# EAGLE design Video (EAGLE 4.13)
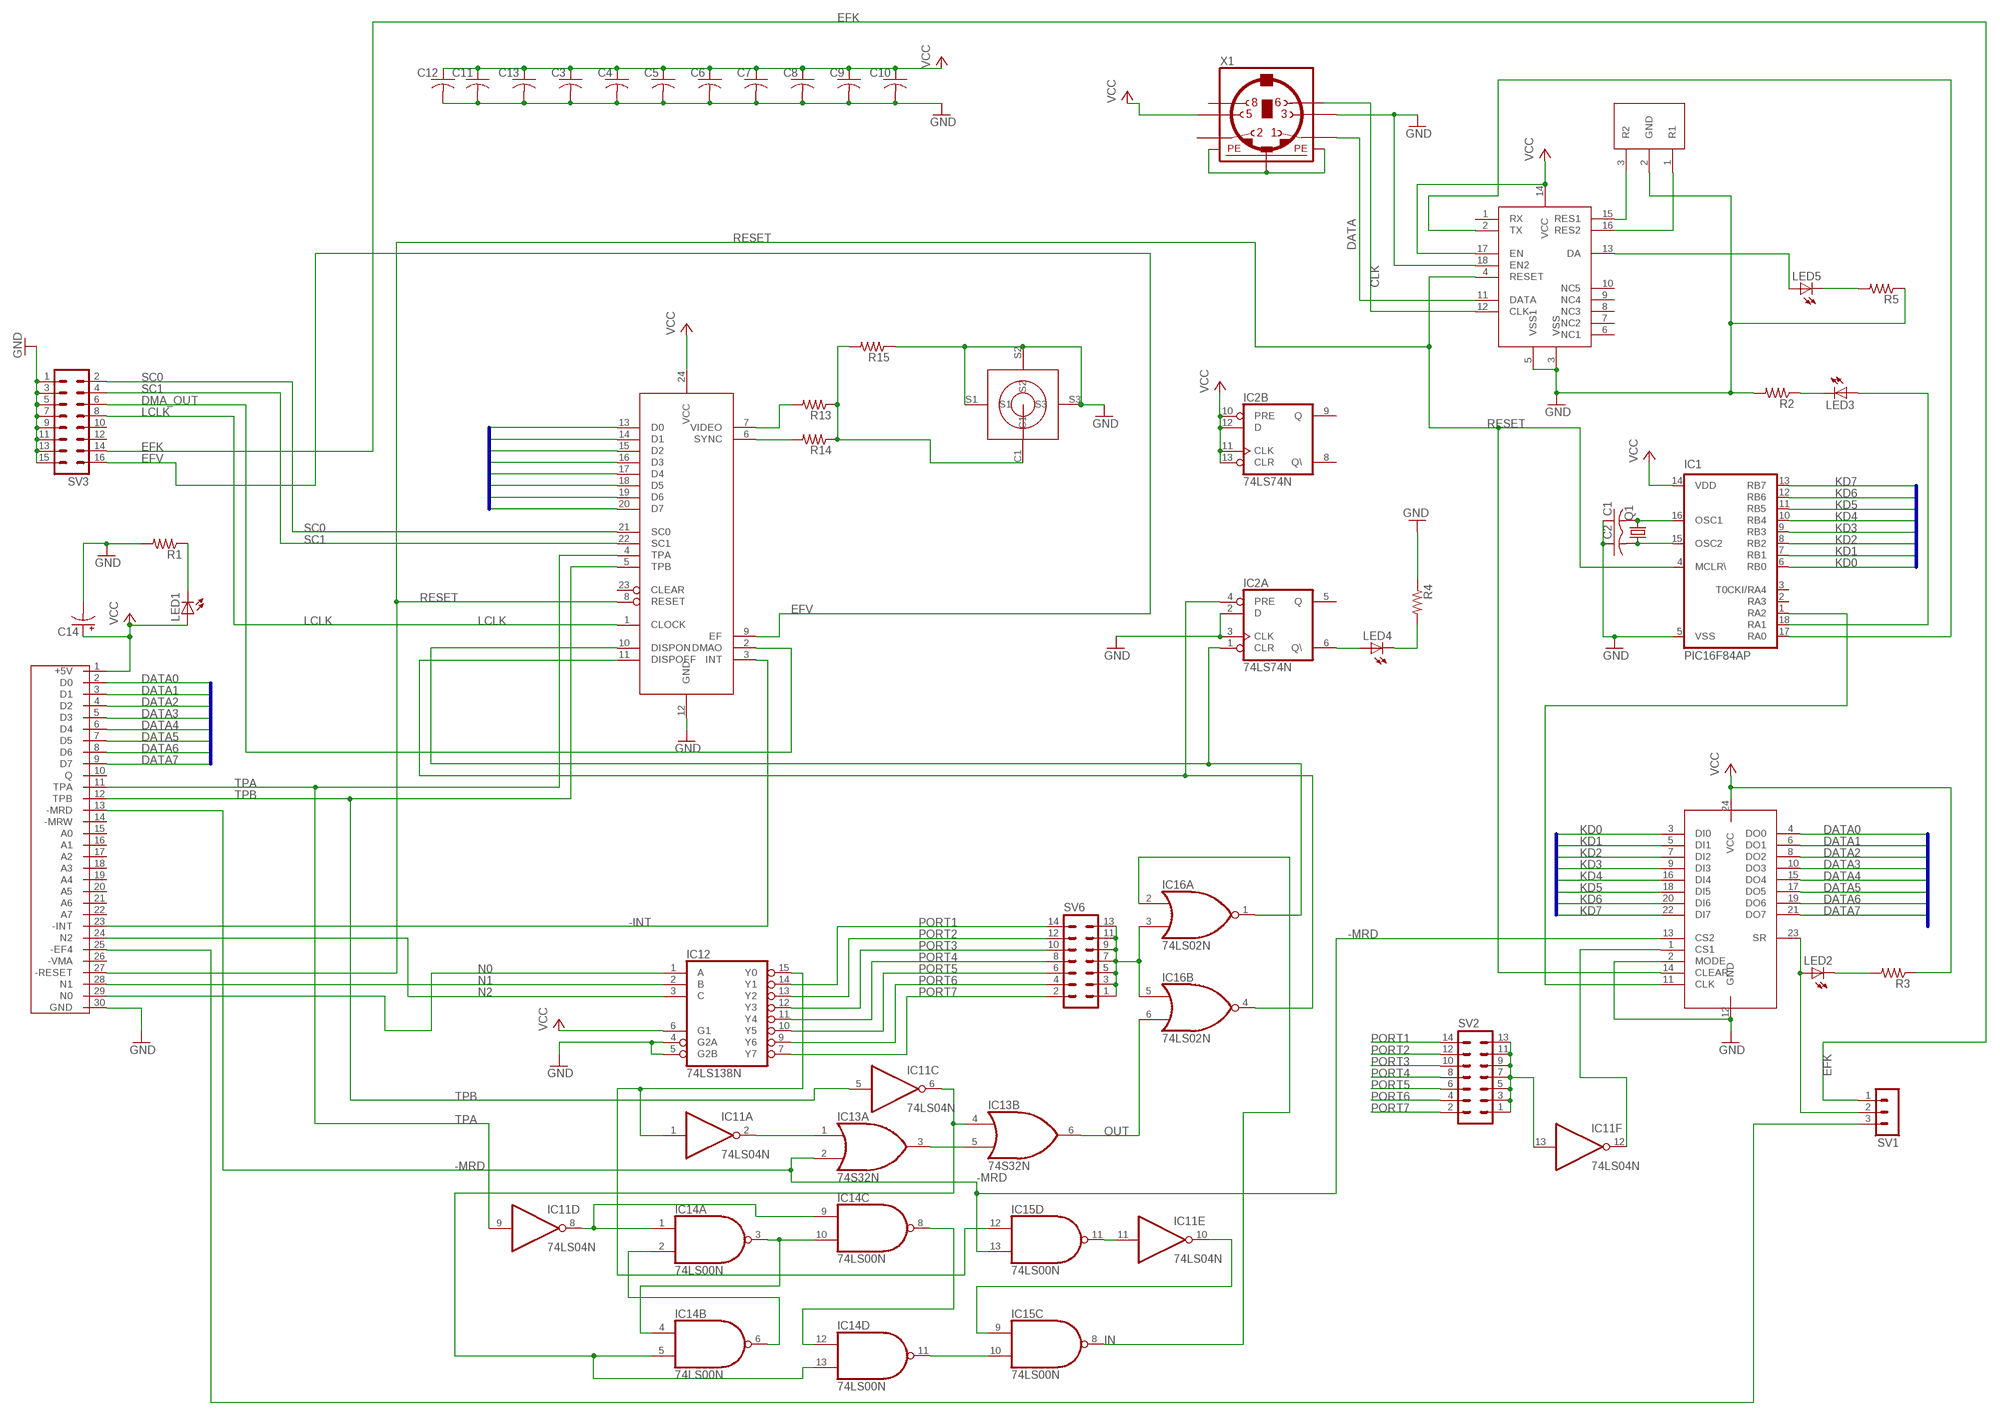
[diagram p0: schematic, sheet 1]

## Parts
C1  C-US025-024X044  [C025-024X044]
C2  C-US025-024X044  [C025-024X044]
C3  C-US025-050X050  [C025-050X050]
C4  C-US025-050X050  [C025-050X050]
C5  C-US025-050X050  [C025-050X050]
C6  C-US025-050X050  [C025-050X050]
C7  C-US025-050X050  [C025-050X050]
C8  C-US025-050X050  [C025-050X050]
C9  C-US025-050X050  [C025-050X050]
C10  C-US025-050X050  [C025-050X050]
C11  C-US025-050X050  [C025-050X050]
C12  C-US025-050X050  [C025-050X050]
C13  C-US025-050X050  [C025-050X050]
C14  CPOL-USE2.5-7  [E2,5-7]
IC1  PIC16F84AP  [DIL18]
IC2  74LS74N  [DIL14]
IC11  74LS04N  [DIL14]
IC12  74LS138N  [DIL16]
IC13  74S32N  [DIL14]
IC14  74LS00N  [DIL14]
IC15  74LS00N  [DIL14]
IC16  74LS02N  [DIL14]
LED1  LED5MM  [LED5MM]
LED2  LED5MM  [LED5MM]
LED3  LED5MM  [LED5MM]
LED4  LED5MM  [LED5MM]
LED5  LED5MM  [LED5MM]
Q1  CRYTALHC49U-V  [HC49U-V]
R1  R-US_0207/2V  [0207/2V]
R2  R-US_0207/2V  [0207/2V]
R3  R-US_0207/2V  [0207/2V]
R4  R-US_0207/2V  [0207/2V]
R5  R-US_0207/2V  [0207/2V]
R13  R-US_0207/2V  [0207/2V]
R14  R-US_0207/2V  [0207/2V]
R15  R-US_0207/2V  [0207/2V]
SV1  MA03-1  [MA03-1]
SV2  MA07-2  [MA07-2]
SV3  MA08-2  [MA08-2]
SV6  MA07-2  [MA07-2]
U$1  1852  [DIL24]
U$2  C30  [C30]
U$3  CDP1861  [DIP24]
U$4  RCA  [RCA]
U$5  PAKVI  [DIL18]
U$6  RESONATOR  [MA03-1]
X1  MINI_DIN_6  [M_DIN6]

## Nets
-INT: U$2.23(-INT) U$3.3(INT)
-MRD: IC13.2(A:I1) IC15.13(D:I1) U$1.13(CS2) U$2.13(-MRD)
CLK: U$5.12(CLK) X1.6
DATA: U$5.11(DATA) X1.1
DATA0: U$1.4(DO0) U$2.2(D0) U$3.13(D0)
DATA1: U$1.6(DO1) U$2.3(D1) U$3.14(D1)
DATA2: U$1.8(DO2) U$2.4(D2) U$3.15(D2)
DATA3: U$1.10(DO3) U$2.5(D3) U$3.16(D3)
DATA4: U$1.15(DO4) U$2.6(D4) U$3.17(D4)
DATA5: U$1.17(DO5) U$2.7(D5) U$3.18(D5)
DATA6: U$1.19(DO6) U$2.8(D6) U$3.19(D6)
DATA7: U$1.21(DO7) U$2.9(D7) U$3.20(D7)
DMA_OUT: SV3.6 U$3.2(DMAO)
EFK: SV1.1 SV3.14
EFV: SV3.16 U$3.9(EF)
GND: C1.1 C2.1 C3.2 C4.2 C5.2 C6.2 C7.2 C8.2 C9.2 C10.2 C11.2 C12.2 C13.2 C14.- IC1.5(VSS) IC2.2(A:D) IC2.3(A:CLK) IC12.4(G2A) IC12.5(G2B) R1.2 R2.2 R4.1 R5.1 R15.1 SV3.1 SV3.3 SV3.5 SV3.7 SV3.9 SV3.11 SV3.13 SV3.15 U$1.2(MODE) U$1.12(GND) U$2.30(GND) U$3.12(GND) U$4.S1 U$4.S2 U$4.S3 U$5.3(VSS) U$5.5(VSS1) U$5.18(EN2) U$6.2(GND) X1.3
IN: IC15.8(C:O) IC16.2(A:I0)
KD0: IC1.6(RB0) U$1.3(DI0)
KD1: IC1.7(RB1) U$1.5(DI1)
KD2: IC1.8(RB2) U$1.7(DI2)
KD3: IC1.9(RB3) U$1.9(DI3)
KD4: IC1.10(RB4) U$1.16(DI4)
KD5: IC1.11(RB5) U$1.18(DI5)
KD6: IC1.12(RB6) U$1.20(DI6)
KD7: IC1.13(RB7) U$1.22(DI7)
LCLK: SV3.8 U$3.1(CLOCK)
N0: IC12.1(A) U$2.29(N0)
N1: IC12.2(B) U$2.28(N1)
N2: IC12.3(C) U$2.24(N2)
N$1: U$5.15(RES1) U$6.3(R2)
N$2: U$5.16(RES2) U$6.1(R1)
N$3: IC1.17(RA0) U$5.2(TX)
N$4: LED3.K(C) R2.1
N$5: IC11.1(A:I) IC12.15(Y0) IC15.12(D:I0)
N$6: IC1.18(RA1) LED3.A
N$7: R14.2 U$3.6(SYNC)
N$8: R13.2 U$3.7(VIDEO)
N$9: R13.1 R14.1 R15.2 U$4.C1
N$10: IC11.2(A:O) IC13.1(A:I0)
N$11: IC13.3(A:O) IC13.5(B:I1)
N$12: IC14.3(A:O) IC14.4(B:I0) IC14.10(C:I1)
N$13: IC14.2(A:I1) IC14.6(B:O)
N$14: IC11.8(D:O) IC14.1(A:I0) IC14.9(C:I0)
N$15: IC1.1(RA2) U$1.11(CLK)
N$16: LED2.A SV1.2 U$1.23(SR)
N$17: SV1.3 U$2.25(-EF4)
N$18: IC11.12(F:O) U$1.1(CS1)
N$19: C1.2 IC1.16(OSC1) Q1.2
N$20: IC11.13(F:I) SV2.1 SV2.3 SV2.5 SV2.7 SV2.9 SV2.11 SV2.13
N$21: C2.2 IC1.15(OSC2) Q1.1
N$22: LED1.K(C) R1.1
N$23: LED2.K(C) R3.2
N$24: IC2.6(A:Q\) LED4.A
N$25: LED4.K(C) R4.2
N$26: IC14.8(C:O) IC14.12(D:I0)
N$27: LED5.A U$5.13(DA)
N$28: IC11.6(C:O) IC13.4(B:I0) IC14.5(B:I1) IC14.13(D:I1)
N$29: LED5.K(C) R5.2
N$30: X1.SH1(PE1) X1.SH2(PE2) X1.SH3(PE3)
N$39: IC14.11(D:O) IC15.10(C:I1)
N$40: IC11.10(E:O) IC15.9(C:I0)
N$41: IC11.11(E:I) IC15.11(D:O)
N$42: IC16.3(A:I1) IC16.5(B:I0) SV6.1 SV6.3 SV6.5 SV6.7 SV6.9 SV6.11 SV6.13
N$43: IC2.1(A:CLR) IC16.1(A:O) U$3.10(DISPON)
N$44: IC2.4(A:PRE) IC16.4(B:O) U$3.11(DISPOFF)
OUT: IC13.6(B:O) IC16.6(B:I1)
PORT1: IC12.14(Y1) SV2.14 SV6.14
PORT2: IC12.13(Y2) SV2.12 SV6.12
PORT3: IC12.12(Y3) SV2.10 SV6.10
PORT4: IC12.11(Y4) SV2.8 SV6.8
PORT5: IC12.10(Y5) SV2.6 SV6.6
PORT6: IC12.9(Y6) SV2.4 SV6.4
PORT7: IC12.7(Y7) SV2.2 SV6.2
RESET: IC1.4(MCLR\) U$1.14(CLEAR) U$2.27(-RESET) U$3.8(RESET) U$5.4(RESET)
SC0: SV3.2 U$3.21(SC0)
SC1: SV3.4 U$3.22(SC1)
TPA: IC11.9(D:I) U$2.11(TPA) U$3.4(TPA)
TPB: IC11.5(C:I) U$2.12(TPB) U$3.5(TPB)
VCC: C3.1 C4.1 C5.1 C6.1 C7.1 C8.1 C9.1 C10.1 C11.1 C12.1 C13.1 C14.+ IC1.14(VDD) IC2.10(B:PRE) IC2.11(B:CLK) IC2.12(B:D) IC2.13(B:CLR) IC12.6(G1) LED1.A R3.1 U$1.24(VCC) U$2.1(+5V) U$3.24(VCC) U$5.14(VCC) U$5.17(EN) X1.5
Unconnected: IC1.2(RA3) IC1.3(T0CKI/RA4) IC2.5(A:Q) IC2.8(B:Q\) IC2.9(B:Q) IC11.3(B:I) IC11.4(B:O) IC13.8(C:O) IC13.9(C:I0) IC13.10(C:I1) IC13.11(D:O) IC13.12(D:I0) IC13.13(D:I1) IC15.1(A:I0) IC15.2(A:I1) IC15.3(A:O) IC15.4(B:I0) IC15.5(B:I1) IC15.6(B:O) IC16.8(C:I0) IC16.9(C:I1) IC16.10(C:O) IC16.11(D:I0) IC16.12(D:I1) IC16.13(D:O) SV3.10 SV3.12 U$2.10(Q) U$2.14(-MRW) U$2.15(A0) U$2.16(A1) U$2.17(A2) U$2.18(A3) U$2.19(A4) U$2.20(A5) U$2.21(A6) U$2.22(A7) U$2.26(-VMA) U$3.23(CLEAR) U$5.1(RX) U$5.6(NC1) U$5.7(NC2) U$5.8(NC3) U$5.9(NC4) U$5.10(NC5) X1.2 X1.8

## Buses
DATA[0..7]
KD[0..7]

## Power pins joined to a net without a drawn wire
GND: IC2.7(P:GND) IC11.7(P:GND) IC12.8(GND) IC13.7(P:GND) IC14.7(P:GND) IC15.7(P:GND) IC16.7(P:GND)
VCC: IC2.14(P:VCC) IC11.14(P:VCC) IC12.16(VCC) IC13.14(P:VCC) IC14.14(P:VCC) IC15.14(P:VCC) IC16.14(P:VCC)

## Library data of the parts
C1-C13 = rcl:C-US: CAPACITOR, American symbol
C14 = rcl:CPOL-US: POLARIZED CAPACITOR, American symbol
IC1 = microchip:PIC16F8*: MICROCONTROLLER 8-Bit PIC16F8X Family - CMOS Flash/EEPROM Pin Compatible : PIC16F83, PIC16CR83, PIC16F84A, PIC16CR84 see also PIC16C*
IC2 = 74xx-us:74*74: Dual D type positive edge triggered FLIP FLOP, preset and clear
IC11 = 74xx-us:74*04: Hex INVERTER
IC12 = 74xx-us:74*138: 3-line to 8-line DECODER/DEMULTIPLEXER
IC13 = 74xx-us:74*32: Quad 2-input OR gate
IC14 IC15 = 74xx-us:74*00: Quad 2-input NAND gate
IC16 = 74xx-us:74*02: Quad 2-input NOR gate
LED1-LED5 = led:LED: LED OSRAM: - CHIPLED LG R971, LG N971, LY N971, LG Q971, LY Q971, LO R971, LY R971 LH N974, LH R974 LS Q976, LO Q976, LY Q976 LO Q996 - Hyper CHIPLED LW Q18S LB Q993, LB Q99A, LB R99A - SideLED LS A670, LO A670, LY A670, LG A670, LP A670 LB A673, LV A673, LT A673, LW A673 LH A674 LY A675 LS A676, LA A676, LO A676, LY A676, LW A676 LS A679, LY A679, LG A679 - Hyper Micro SIDELED® LS Y876, LA Y876, LO Y876, LY Y876 LT Y87S - SmartLED LW L88C, LW L88S LB L89C, LB L89S, LG L890 LS L89K, LO L89K, LY L89K LS L896, LA L896, LO L896, LY L896 - TOPLED LS T670, LO T670, LY T670, LG T670, LP T670 LSG T670, LSP T670, LSY T670, LOP T670, LYG T670 LG T671, LOG T671, LSG T671 LB T673, LV T673, LT T673, LW T673 LH T674 LS T676, LA T676, LO T676, LY T676, LB T676, LH T676, LSB T676, LW T676 LB T67C, LV T67C, LT T67C, LS T67K, LO T67K, LY T67K, LW E67C LS E67B, LA E67B, LO E67B, LY E67B, LB E67C, LV E67C, LT E67C LW T67C LS T679, LY T679, LG T679 LS T770, LO T770, LY T770, LG T770, LP T770 LB T773, LV T773, LT T773, LW T773 LH T774 LS E675, LA E675, LY E675, LS T675 LS T776, LA T776, LO T776, LY T776, LB T776 LHGB T686 LT T68C, LB T68C - Hyper Mini TOPLED® LB M676 - Mini TOPLED Santana® LG M470 LS M47K, LO M47K, LY M47K Source: http://www.osram.convergy.de/
Q1 = crystal:CRYTAL: CRYSTAL
R1-R5 R13-R15 = rcl:R-US_: RESISTOR, American symbol
SV1 = con-lstb:MA03-1: PIN HEADER
SV2 SV6 = con-lstb:MA07-2: PIN HEADER
SV3 = con-lstb:MA08-2: PIN HEADER
U$1 = k1:1852
U$2 = k1:C30
U$3 = cdp:CDP1861
U$4 = cdp:RCA
U$5 = k1:PAKVI
U$6 = k1:RESONATOR
X1 = mini_din:MINI_DIN_6

## Board
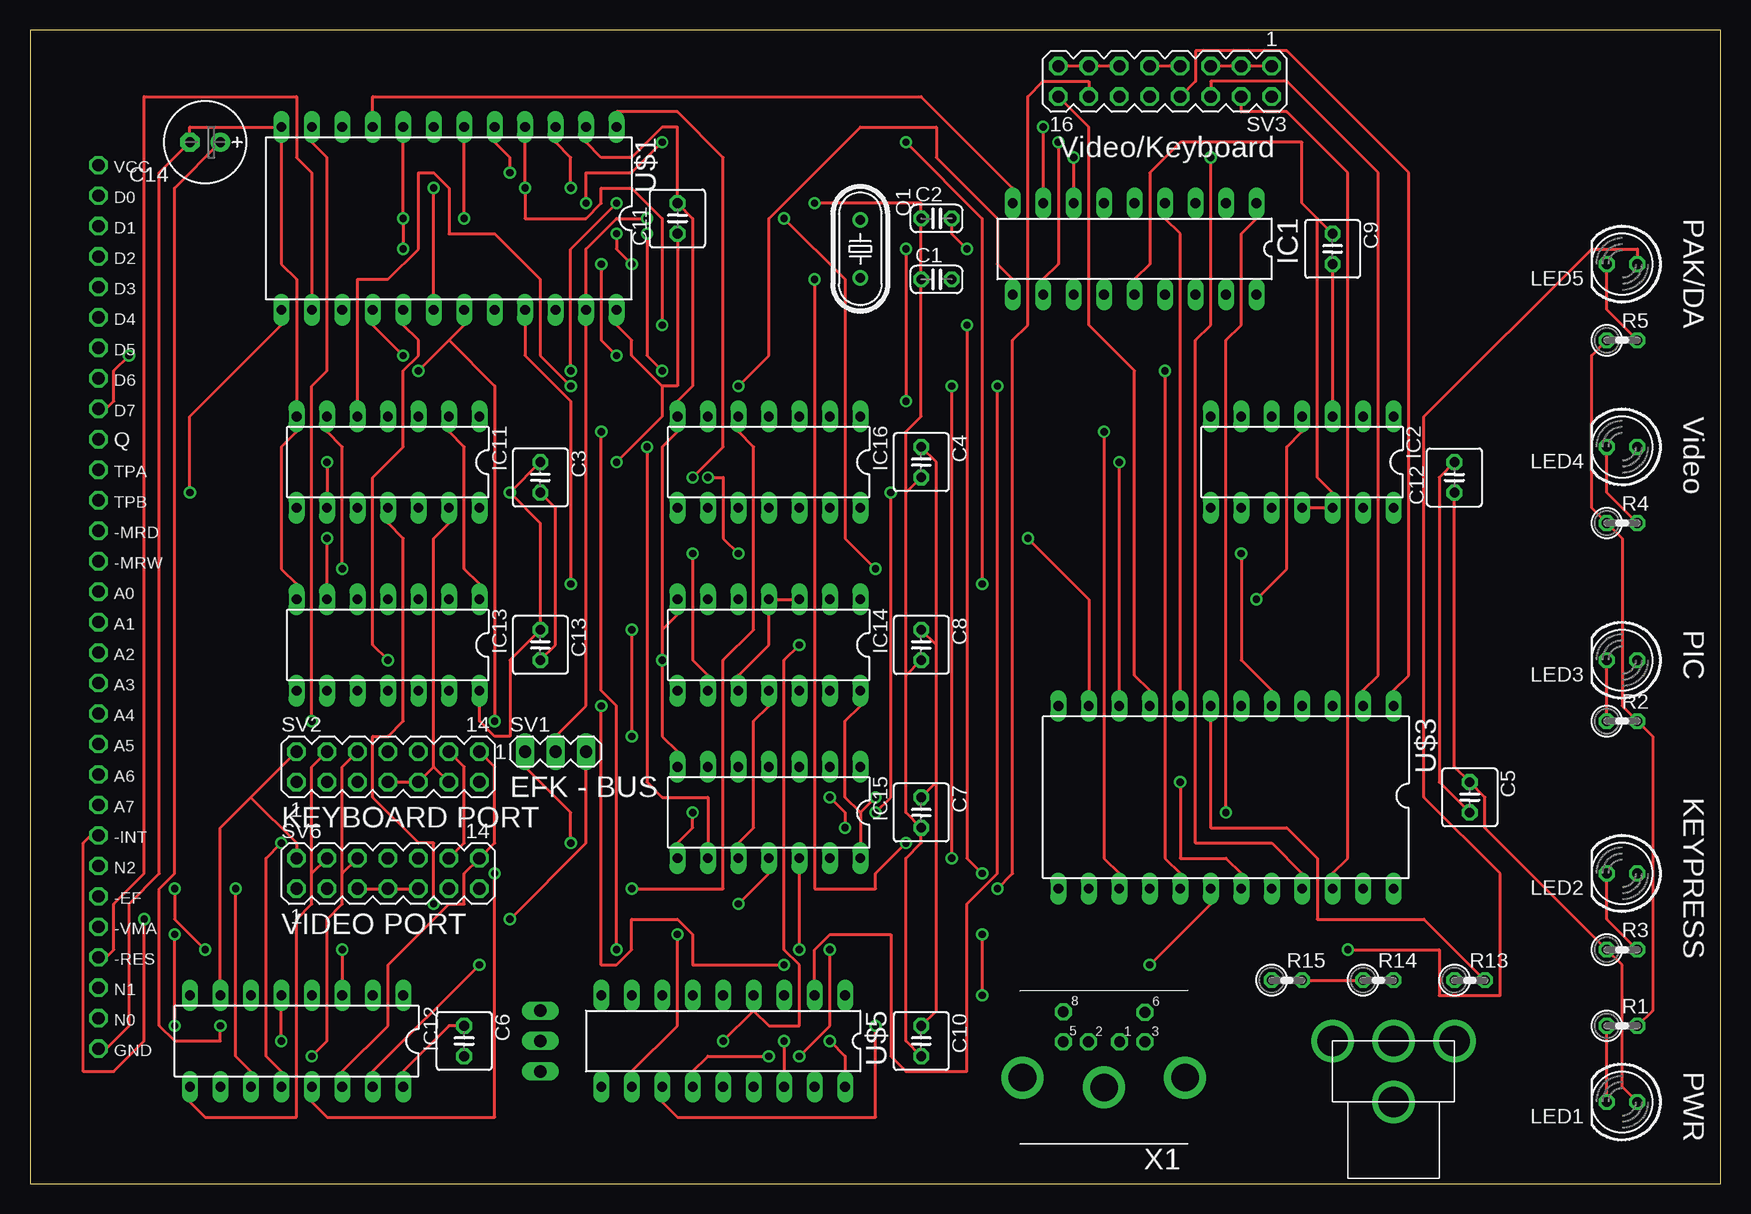
[diagram p1: board, top side]
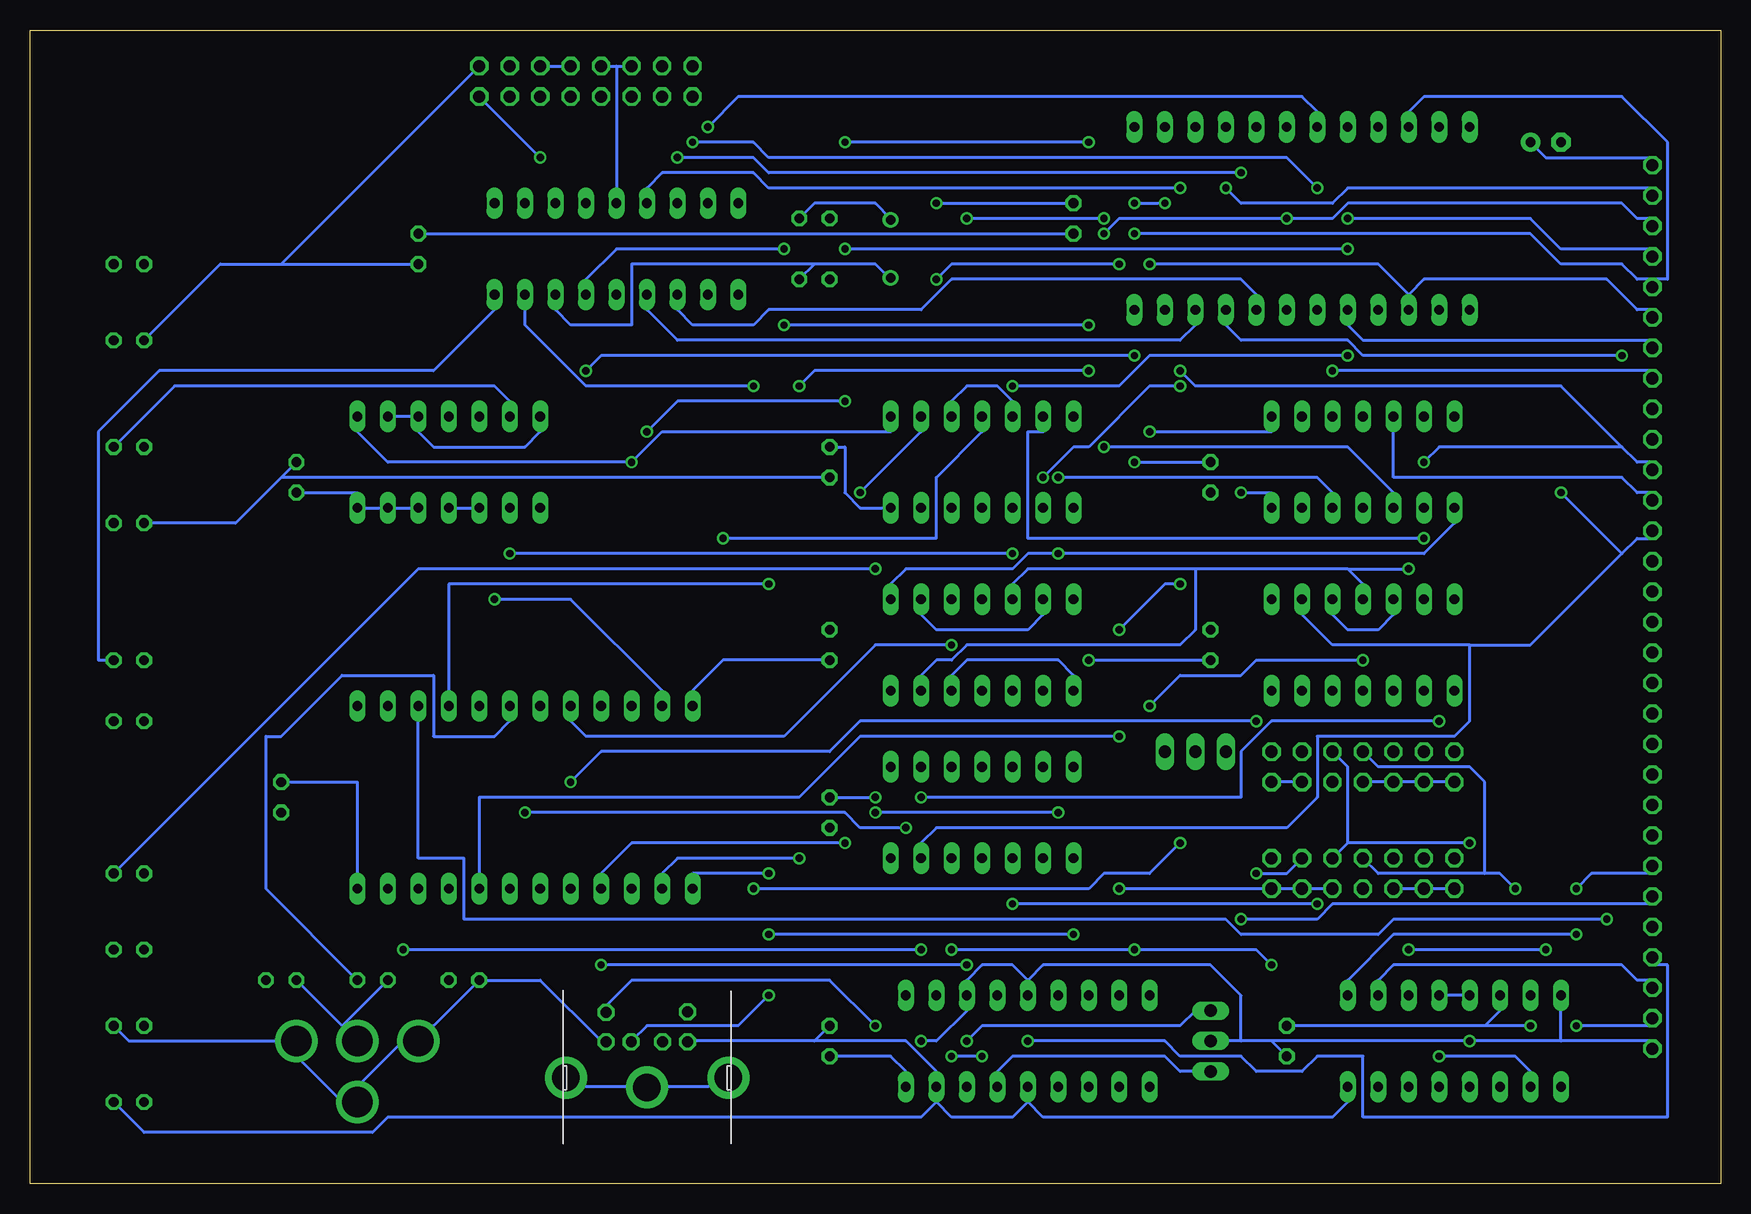
[diagram p2: board, bottom side, seen from below]

Size 140.95 x 96.19 mm. Coordinates in mm from the lower left corner, seen from the top.
Outline: 0,0 140.95,0 140.95,96.19 0,96.19 0,0
Copper layers (1*16): Top 0.035mm / dielectric 1.5mm / Bottom 0.035mm
Design rules "default": minimum track width 10mil, minimum drill 24mil, track to track 8mil, track to pad 8mil, pad to pad 8mil, via to via 8mil, smd to smd 8mil, copper to edge 40mil, drill to drill 8mil, minimum pad ring 10mil, minimum via ring 8mil, stop-mask expansion 4mil, vias tented up to drill 0mil, thermal gap 10mil
tRestrict: area 0.6,0.5 to 76.8,4.3; area 0.6,91.9 to 76.8,95.7; area 103.5,1.7 to 123.8,14.4; area 80.6,3 to 99.7,17
bRestrict: area 0.6,0.5 to 76.8,4.3; area 0.6,0.5 to 76.8,4.3; area 0.6,91.9 to 76.8,95.7

### Footprints (pad centres in the part's own frame; a part is rotated, then mirrored left to right if it is on the bottom)
C025-024X044 = drill 0.813 octagon: 1 -1.27,0; 2 1.27,0
C025-050X050 = drill 0.813 octagon: 1 -1.27,0; 2 1.27,0
E2,5-7 = drill 0.813 pad 1.6 round: + -1.27,0 | drill 0.813 pad 1.6 octagon: - 1.27,0
DIL18 = drill 0.813 long: 1 -10.16,-3.81; 2 -7.62,-3.81; 3 -5.08,-3.81; 4 -2.54,-3.81; 5 0,-3.81; 6 2.54,-3.81; 7 5.08,-3.81; 8 7.62,-3.81; 9 10.16,-3.81; 10 10.16,3.81; 11 7.62,3.81; 12 5.08,3.81; 13 2.54,3.81; 14 0,3.81; 15 -2.54,3.81; 16 -5.08,3.81; 17 -7.62,3.81; 18 -10.16,3.81
DIL14 = drill 0.813 long: 1 -7.62,-3.81; 2 -5.08,-3.81; 3 -2.54,-3.81; 4 0,-3.81; 5 2.54,-3.81; 6 5.08,-3.81; 7 7.62,-3.81; 8 7.62,3.81; 9 5.08,3.81; 10 2.54,3.81; 11 0,3.81; 12 -2.54,3.81; 13 -5.08,3.81; 14 -7.62,3.81
DIL16 = drill 0.813 long: 1 -8.89,-3.81; 2 -6.35,-3.81; 3 -3.81,-3.81; 4 -1.27,-3.81; 5 1.27,-3.81; 6 3.81,-3.81; 7 6.35,-3.81; 8 8.89,-3.81; 9 8.89,3.81; 10 6.35,3.81; 11 3.81,3.81; 12 1.27,3.81; 13 -1.27,3.81; 14 -3.81,3.81; 15 -6.35,3.81; 16 -8.89,3.81
LED5MM = drill 0.813 octagon: A -1.27,0; K 1.27,0
HC49U-V = drill 0.813 round: 1 -2.413,0; 2 2.413,0
0207/2V = drill 0.813 octagon: 1 -1.27,0; 2 1.27,0
MA03-1 = drill 1.016 long: 1 -2.54,0; 2 0,0; 3 2.54,0
MA07-2 = drill 1.016 octagon: 1 -7.62,-1.27; 2 -7.62,1.27; 3 -5.08,-1.27; 4 -5.08,1.27; 5 -2.54,-1.27; 6 -2.54,1.27; 7 0,-1.27; 8 0,1.27; 9 2.54,-1.27; 10 2.54,1.27; 11 5.08,-1.27; 12 5.08,1.27; 13 7.62,-1.27; 14 7.62,1.27
MA08-2 = drill 1.016 octagon: 1 -8.89,-1.27; 2 -8.89,1.27; 3 -6.35,-1.27; 4 -6.35,1.27; 5 -3.81,-1.27; 6 -3.81,1.27; 7 -1.27,-1.27; 8 -1.27,1.27; 9 1.27,-1.27; 10 1.27,1.27; 11 3.81,-1.27; 12 3.81,1.27; 13 6.35,-1.27; 14 6.35,1.27; 15 8.89,-1.27; 16 8.89,1.27
DIL24 = drill 0.813 long: 1 -13.97,-7.62; 2 -11.43,-7.62; 3 -8.89,-7.62; 4 -6.35,-7.62; 5 -3.81,-7.62; 6 -1.27,-7.62; 7 1.27,-7.62; 8 3.81,-7.62; 9 6.35,-7.62; 10 8.89,-7.62; 11 11.43,-7.62; 12 13.97,-7.62; 13 13.97,7.62; 14 11.43,7.62; 15 8.89,7.62; 16 6.35,7.62; 17 3.81,7.62; 18 1.27,7.62; 19 -1.27,7.62; 20 -3.81,7.62; 21 -6.35,7.62; 22 -8.89,7.62; 23 -11.43,7.62; 24 -13.97,7.62
C30 = drill 1.016 octagon: 1 -36.83,0; 2 -34.29,0; 3 -31.75,0; 4 -29.21,0; 5 -26.67,0; 6 -24.13,0; 7 -21.59,0; 8 -19.05,0; 9 -16.51,0; 10 -13.97,0; 11 -11.43,0; 12 -8.89,0; 13 -6.35,0; 14 -3.81,0; 15 -1.27,0; 16 1.27,0; 17 3.81,0; 18 6.35,0; 19 8.89,0; 20 11.43,0; 21 13.97,0; 22 16.51,0; 23 19.05,0; 24 21.59,0; 25 24.13,0; 26 26.67,0; 27 29.21,0; 28 31.75,0; 29 34.29,0; 30 36.83,0
DIP24 = drill 0.813 long: 1 -12.7,-7.62; 2 -10.16,-7.62; 3 -7.62,-7.62; 4 -5.08,-7.62; 5 -2.54,-7.62; 6 0,-7.62; 7 2.54,-7.62; 8 5.08,-7.62; 9 7.62,-7.62; 10 10.16,-7.62; 11 12.7,-7.62; 12 15.24,-7.62; 13 15.24,7.62; 14 12.7,7.62; 15 10.16,7.62; 16 7.62,7.62; 17 5.08,7.62; 18 2.54,7.62; 19 0,7.62; 20 -2.54,7.62; 21 -5.08,7.62; 22 -7.62,7.62; 23 -10.16,7.62; 24 -12.7,7.62
RCA = drill 2.54 round: C1 5.08,0; S1 0,0; S2 5.08,5.08; S3 10.16,0
M_DIN6 = drill 0.9 pad 1.422 octagon: 1 -1.3,-3.75; 2 1.3,-3.75; 3 -3.4,-3.75; 5 3.4,-3.75; 6 -3.4,-6.2; 8 3.4,-6.25 | drill 2.3 pad 3.5 round: SH1 6.8,-0.75; SH2 0,0.05; SH3 -6.75,-0.75

### Placement (x,y rotation side)
C1  75.56,75.4 0 top
C2  75.56,80.48 0 top
C3  42.54,58.89 270 top
C4  74.29,60.16 270 top
C5  120.01,32.22 270 top
C6  36.19,11.9 270 top
C7  74.29,30.95 270 top
C8  74.29,44.92 270 top
C9  108.58,77.94 270 top
C10  74.29,11.9 270 top
C11  53.97,80.48 90 top
C12  118.74,58.89 90 top
C13  42.54,44.92 270 top
C14  14.6,86.83 180 top
IC1  92.07,77.94 180 top
IC2  106.04,60.16 180 top
IC11  29.84,60.16 180 top
IC12  22.22,11.9 180 top
IC13  29.84,44.92 180 top
IC14  61.59,44.92 180 top
IC15  61.59,30.95 180 top
IC16  61.59,60.16 180 top
LED1  132.71,6.82 180 top
LED2  132.71,25.87 180 top
LED3  132.71,43.65 180 top
LED4  132.71,61.43 180 top
LED5  132.71,76.67 180 top
Q1  69.21,77.94 270 top
R1  132.71,13.17 0 top
R2  132.71,38.57 0 top
R3  132.71,19.52 0 top
R4  132.71,55.08 0 top
R5  132.71,70.32 0 top
R13  120.01,16.98 0 top
R14  112.39,16.98 0 top
R15  104.77,16.98 0 top
SV1  43.81,36.03 0 top
SV2  29.84,34.76 0 top
SV3  94.61,91.91 180 top
SV6  29.84,25.87 0 top
U$1  34.92,80.48 180 top
U$2  5.71,48.09 270 top
U$3  100.96,32.22 180 top
U$4  118.74,11.9 180 top
U$5  57.78,11.9 180 top
U$6  42.54,11.9 270 top
X1  89.53,8.09 180 top

### Tracks (layer width: path | path; a pad name or v marks a point on that pad's centre or on a via)
-INT  (via drill 0.61)
  Top 0.254: v9.52,22.06 9.52,11.9 6.98,9.36 4.44,9.36 4.44,28.41 5.71,29.68 U$2.23
  Bottom 0.254: v9.52,22.06 27.3,22.06 28.57,20.79 40,20.79 41.27,22.06 104.77,22.06 104.77,27.14 108.58,27.14 U$3.3
-MRD  (via drill 0.61)
  Top 0.254: v13.33,57.62 13.33,63.97 20.95,71.59 U$1.13
  Bottom 0.254: 20.95,44.92 15.87,44.92 8.25,52.54 | 20.95,44.92 32.38,44.92 34.92,47.46 IC13.2 | 8.25,52.54 6.98,53.81 5.71,53.81 U$2.13 | 20.95,44.92 20.95,38.57 22.22,37.3 33.65,37.3 33.65,32.22 36.19,29.68 65.4,29.68 66.67,28.41 IC15.13 | 8.25,52.54 v13.33,57.62
CLK  (via drill 0.61)
  Top 0.254: v70.48,13.17 70.48,5.55 53.97,5.55 52.7,6.82 U$5.12
  Bottom 0.254: v70.48,13.17 74.29,16.98 90.8,16.98 93.34,14.44 X1.6
DATA  (via drill 0.61)
  Top 0.254: v53.97,20.79 53.97,13.17 50.16,9.36 U$5.11 | v79.37,20.79 v79.37,15.71
  Bottom 0.254: v53.97,20.79 v79.37,20.79 | v79.37,15.71 81.91,13.17 89.53,13.17 90.8,11.9 X1.1
DATA0  (via drill 0.61)
  Top 0.254: U$1.4 v41.27,83.02 41.27,80.48 46.35,80.48 47.62,81.75 47.62,83.02 50.16,83.02 52.7,80.48 v52.7,71.59 | v79.37,25.87 78.1,27.14 v78.1,71.59
  Bottom 0.254: v41.27,83.02 40,81.75 32.38,81.75 31.11,83.02 5.71,83.02 U$2.2 | v79.37,25.87 85.72,25.87 U$3.13 | v52.7,71.59 v78.1,71.59
DATA1  (via drill 0.61)
  Top 0.254: v76.83,66.51 v76.83,27.14 | v52.7,67.78 51.43,69.05 v51.43,79.21 | v36.19,80.48 U$1.6
  Bottom 0.254: v76.83,27.14 86.99,27.14 88.26,25.87 U$3.14 | v76.83,66.51 75.56,67.78 v52.7,67.78 | v51.43,79.21 50.16,80.48 v36.19,80.48 32.38,80.48 31.11,81.75 8.25,81.75 6.98,80.48 5.71,80.48 U$2.3
DATA2  (via drill 0.61)
  Top 0.254: v89.53,62.7 89.53,27.14 90.8,25.87 U$3.15 | v73.02,77.94 v73.02,65.24 | v31.11,77.94 v31.11,80.48 U$1.8
  Bottom 0.254: v89.53,62.7 86.99,65.24 v73.02,65.24 | v31.11,77.94 v73.02,77.94 | v31.11,80.48 15.87,80.48 13.33,77.94 5.71,77.94 U$2.4
DATA3  (via drill 0.61)
  Top 0.254: v73.02,28.41 70.48,25.87 70.48,24.6 65.4,24.6 v65.4,75.4 | v50.16,76.67 48.89,77.94 v48.89,79.21
  Bottom 0.254: 5.71,75.4 4.44,75.4 4.44,86.83 8.25,90.64 24.76,90.64 26.03,89.37 U$1.10 | v73.02,28.41 90.8,28.41 93.34,25.87 U$3.16 | v65.4,75.4 64.13,76.67 v50.16,76.67 | v48.89,79.21 15.87,79.21 13.33,76.67 8.25,76.67 6.98,75.4 5.71,75.4 | 5.71,75.4 U$2.5
DATA4  (via drill 0.61)
  Top 0.254: v94.61,67.78 94.61,27.14 95.88,25.87 U$3.17 | v48.89,69.05 47.62,70.32 v47.62,76.67
  Bottom 0.254: 26.03,74.13 24.76,75.4 9.52,75.4 6.98,72.86 5.71,72.86 U$2.6 | v94.61,67.78 93.34,69.05 v48.89,69.05 | v47.62,76.67 28.57,76.67 26.03,74.13 | 26.03,74.13 U$1.15
DATA5  (via drill 0.61)
  Top 0.254: v93.34,18.25 98.42,23.33 U$3.18 | v62.86,18.25 55.24,18.25 55.24,20.79 53.97,22.06 50.16,22.06 50.16,19.52 48.89,18.25 47.62,18.25 v47.62,39.84 | v29.84,43.65 28.57,44.92 28.57,58.89 31.11,61.43 31.11,67.78 32.38,69.05 32.38,70.32 31.11,71.59 U$1.17
  Bottom 0.254: U$1.17 31.11,71.59 29.84,70.32 5.71,70.32 U$2.7 | v62.86,18.25 v93.34,18.25 | v47.62,39.84 45.08,42.38 40,42.38 38.73,43.65 v29.84,43.65
DATA6  (via drill 0.61)
  Top 0.254: v32.38,67.78 34.92,70.32 | 34.92,70.32 36.19,71.59 U$1.19 | v95.88,33.49 95.88,27.14 99.69,27.14 100.96,25.87 U$3.19 | v38.73,38.57 38.73,66.51 34.92,70.32
  Bottom 0.254: v32.38,67.78 5.71,67.78 U$2.8 | v95.88,33.49 93.34,36.03 74.29,36.03 71.75,38.57 v38.73,38.57
DATA7  (via drill 0.61)
  Top 0.254: v8.25,69.05 6.98,67.78 6.98,65.24 5.71,63.97 U$2.9 | v50.16,46.19 v50.16,37.3 | v45.08,50 45.08,65.24 41.27,69.05 U$1.21
  Bottom 0.254: v8.25,69.05 29.84,69.05 31.11,70.32 40,70.32 41.27,71.59 U$1.21 | v50.16,37.3 71.75,37.3 76.83,32.22 103.5,32.22 U$3.20 | v50.16,46.19 46.35,50 v45.08,50
DMA_OUT
  Top 0.254: SV3.6 98.42,91.91 104.77,91.91 112.39,84.29 112.39,42.38 111.12,41.11 U$3.2
EFK  (via drill 0.61)
  Top 0.254: v45.08,28.41 45.08,30.95 41.27,34.76 SV1.1 | v80.64,24.6 81.91,25.87 81.91,70.32 83.18,71.59 83.18,90.64 84.45,91.91 88.26,91.91 SV3.14
  Bottom 0.254: v45.08,28.41 47.62,25.87 51.43,25.87 52.7,24.6 v80.64,24.6
EFV
  Top 0.254: SV3.16 88.26,88.1 88.26,71.59 92.07,67.78 92.07,42.38 93.34,41.11 U$3.9
GND  (via drill 0.61)
  Top 0.254: IC13.7 22.22,50 20.95,51.27 20.95,61.43 22.22,62.7 IC11.7 22.22,75.4 20.95,76.67 U$1.12 13.33,88.1 C14.- 10.79,84.29 10.79,25.87 8.25,23.33 8.25,13.17 5.71,10.63 U$2.30 | v20.95,11.9 IC12.5 | C13.2 43.81,44.92 43.81,56.35 C3.2 | 52.7,46.19 v52.7,43.65 52.7,37.3 53.97,36.03 IC15.7 | 52.7,46.19 53.97,47.46 IC14.7 | 52.7,46.19 52.7,61.43 53.97,62.7 IC16.7 53.97,65.24 55.24,66.51 55.24,80.48 C11.2 53.97,88.1 52.7,88.1 50.16,85.56 47.62,85.56 46.35,86.83 U$1.2 | 73.02,42.38 73.02,30.95 C7.2 74.29,28.41 73.02,27.14 73.02,11.9 C10.2 | 73.02,42.38 C8.2 | 73.02,57.62 C4.2 | 73.02,42.38 73.02,57.62 | 73.02,57.62 73.02,62.7 74.29,63.97 C1.1 C2.1 74.29,81.75 v65.4,81.75 | C5.2 117.47,33.49 117.47,58.89 C12.2 | SV3.5 SV3.3 SV3.1 | SV3.15 SV3.13 SV3.11 | SV3.7 SV3.9 | C9.2 IC2.3 | R5.1 130.17,69.05 130.17,56.35 R4.1 132.71,53.81 132.71,39.84 R2.2 135.25,37.3 135.25,14.44 R1.2 | v66.67,11.9 67.94,10.63 U$5.18
  Bottom 0.254: IC12.5 IC12.4 | 13.33,11.9 5.71,11.9 U$2.30 | 13.33,11.9 IC12.8 | 13.33,11.9 v20.95,11.9 37.46,11.9 | 57.78,16.98 59.05,18.25 61.59,18.25 62.86,16.98 U$5.3 62.86,14.44 65.4,11.9 v66.67,11.9 | 37.46,11.9 C6.2 | 37.46,11.9 40,11.9 | 40,11.9 U$6.2 | 57.78,16.98 56.51,18.25 42.54,18.25 40,15.71 40,11.9 | 57.78,16.98 U$5.5 | v52.7,43.65 C13.2 | C10.2 69.21,10.63 67.94,9.36 U$5.18 | C8.2 83.18,43.65 85.72,41.11 U$3.12 | v65.4,81.75 C11.2 | X1.3 93.34,11.9 98.42,16.98 R15.1 107.31,13.17 108.58,13.17 U$4.S3 109.85,11.9 113.66,8.09 U$4.S2 114.93,6.82 118.74,10.63 U$4.S1 132.71,11.9 R1.2 | 120.01,58.89 123.82,55.08 R4.1 | 120.01,58.89 C12.2 | 92.07,93.18 SV3.11 | 92.07,93.18 IC1.5 | SV3.9 92.07,93.18 | SV3.5 SV3.7 | IC2.7 98.42,62.7 99.69,61.43 107.31,61.43 108.58,62.7 IC2.3 IC2.2 | R5.1 125.09,76.67 120.01,76.67 | 120.01,76.67 C9.2 | 120.01,76.67 SV3.1 | C4.2 120.01,58.89
IN  (via drill 0.61)
  Top 0.254: v55.24,30.95 55.24,29.68 53.97,28.41 IC15.8 | v70.48,30.95 71.75,32.22 v71.75,57.62
  Bottom 0.254: v55.24,30.95 v70.48,30.95 | v71.75,57.62 66.67,62.7 IC16.2
KD0  (via drill 0.61)
  Top 0.254: v45.08,83.02 45.08,85.56 43.81,86.83 U$1.3
  Bottom 0.254: v45.08,83.02 79.37,83.02 80.64,84.29 88.26,84.29 89.53,83.02 IC1.6
KD1  (via drill 0.61)
  Top 0.254: v40,84.29 40,85.56 38.73,86.83 U$1.5 | v86.99,85.56 IC1.7
  Bottom 0.254: v40,84.29 79.37,84.29 80.64,85.56 v86.99,85.56
KD2  (via drill 0.61)
  Top 0.254: v84.45,88.1 IC1.8
  Bottom 0.254: v84.45,88.1 81.91,90.64 34.92,90.64 33.65,89.37 U$1.7
KD3
  Top 0.254: IC1.9 81.91,83.02 74.29,90.64 28.57,90.64 U$1.9
KD4  (via drill 0.61)
  Top 0.254: v31.11,69.05 28.57,71.59 U$1.16 | v59.05,66.51 61.59,69.05 61.59,80.48 69.21,88.1 75.56,88.1 75.56,85.56 80.64,80.48 80.64,76.67 81.91,75.4 IC1.10
  Bottom 0.254: v31.11,69.05 47.62,69.05 50.16,66.51 v59.05,66.51
KD5  (via drill 0.61)
  Top 0.254: v85.72,86.83 85.72,76.67 84.45,75.4 IC1.11 | U$1.18 v33.65,83.02
  Bottom 0.254: v33.65,83.02 36.19,85.56 79.37,85.56 80.64,86.83 v85.72,86.83
KD6
  Bottom 0.254: U$1.20 38.73,74.13 40,75.4 64.13,75.4 66.67,72.86 79.37,72.86 80.64,71.59 85.72,71.59 86.99,72.86 IC1.12
KD7
  Bottom 0.254: U$1.22 43.81,71.59 45.08,70.32 86.99,70.32 89.53,72.86 IC1.13
LCLK
  Top 0.254: SV3.8 97.15,91.91 97.15,94.45 104.77,94.45 114.93,84.29 114.93,42.38 113.66,41.11 U$3.1
N0  (via drill 0.61)
  Top 0.254: v12.06,13.17 v12.06,20.79
  Bottom 0.254: v12.06,20.79 27.3,20.79 31.11,16.98 IC12.1 | v12.06,13.17 5.71,13.17 U$2.29
N1
  Bottom 0.254: IC12.2 28.57,16.98 27.3,18.25 8.25,18.25 6.98,16.98 5.71,16.98 U$2.28
N2  (via drill 0.61)
  Top 0.254: v14.6,19.52 12.06,22.06 v12.06,24.6 | v26.03,19.52 IC12.3
  Bottom 0.254: v14.6,19.52 v26.03,19.52 | v12.06,24.6 10.79,25.87 5.71,25.87 U$2.24
N$1
  Bottom 0.254: U$5.15 60.32,9.36 59.05,10.63 46.35,10.63 45.08,9.36 U$6.3
N$2  (via drill 0.61)
  Top 0.254: v62.86,11.9 U$5.16
  Bottom 0.254: v62.86,11.9 61.59,13.17 45.08,13.17 43.81,14.44 U$6.1
N$3  (via drill 0.61)
  Top 0.254: v80.64,66.51 80.64,25.87 78.1,23.33 78.1,9.36 73.02,9.36 71.75,10.63 71.75,20.79 66.67,20.79 65.4,19.52 U$5.2
  Bottom 0.254: v80.64,66.51 94.61,66.51 99.69,71.59 IC1.17
N$4
  Top 0.254: R2.1 LED3.K
N$5  (via drill 0.61)
  Top 0.254: v37.46,18.25 28.57,9.36 IC12.15 | v64.13,19.52 IC15.12 | v47.62,62.7 47.62,41.11 48.89,39.84 v48.89,19.52
  Bottom 0.254: v37.46,18.25 38.73,19.52 v48.89,19.52 v64.13,19.52 | v47.62,62.7 37.46,62.7 IC11.1
N$6
  Bottom 0.254: LED3.A 135.25,43.65 135.25,62.7 130.17,67.78 107.31,67.78 102.23,72.86 IC1.18
N$7
  Bottom 0.254: R14.2 121.28,24.6 121.28,37.3 120.01,37.3 114.93,42.38 107.31,42.38 107.31,37.3 102.23,37.3 100.96,38.57 U$3.6
N$8
  Top 0.254: R13.2 116.2,22.06 107.31,22.06 107.31,27.14 104.77,29.68 98.42,29.68 U$3.7
N$9
  Top 0.254: R15.2 R14.1
  Bottom 0.254: 114.93,13.17 R13.1 | 114.93,13.17 113.66,13.17 U$4.C1 | R14.1 114.93,13.17
N$10
  Top 0.254: IC13.1 37.46,50 36.19,51.27 36.19,61.43 34.92,62.7 IC11.2
N$11
  Bottom 0.254: IC13.5 27.3,47.46 28.57,46.19 31.11,46.19 32.38,47.46 IC13.3
N$12
  Top 0.254: IC14.10 59.05,42.38 61.59,44.92 IC14.4 IC14.3
N$13
  Bottom 0.254: IC14.6 56.51,47.46 57.78,46.19 65.4,46.19 66.67,47.46 IC14.2
N$14  (via drill 0.61)
  Top 0.254: v55.24,52.54 55.24,43.65 56.51,42.38 IC14.9
  Bottom 0.254: IC11.8 22.22,55.08 24.76,52.54 v55.24,52.54 57.78,52.54 59.05,51.27 67.94,51.27 69.21,50 IC14.1
N$15  (via drill 0.61)
  Top 0.254: v23.49,38.57 23.49,66.51 24.76,67.78 24.76,85.56 23.49,86.83 U$1.11 | v66.67,32.22 67.94,30.95 v67.94,29.68 | v99.69,30.95 99.69,70.32 100.96,71.59 100.96,79.21 102.23,80.48 IC1.1
  Bottom 0.254: v23.49,38.57 37.46,38.57 40,36.03 40,32.22 v66.67,32.22 | v67.94,29.68 71.75,29.68 73.02,30.95 v99.69,30.95
N$16  (via drill 0.61)
  Top 0.254: SV1.2 43.81,37.3 46.35,39.84 U$1.23 46.35,77.94 48.89,80.48 v51.43,80.48 | v70.48,51.27 67.94,53.81 67.94,75.4 v62.86,80.48
  Bottom 0.254: LED2.A 108.58,51.27 v70.48,51.27 | v51.43,80.48 v62.86,80.48
N$17  (via drill 0.61)
  Top 0.254: v40,22.06 46.35,28.41 SV1.3
  Bottom 0.254: v40,22.06 33.65,22.06 32.38,23.33 5.71,23.33 U$2.25
N$18  (via drill 0.61)
  Top 0.254: v55.24,58.89 57.78,61.43 57.78,85.56 53.97,89.37 48.89,89.37 U$1.1
  Bottom 0.254: v55.24,58.89 33.65,58.89 32.38,57.62 IC11.12
N$19
  Bottom 0.254: 75.56,76.67 C1.2 | 75.56,76.67 70.48,76.67 69.21,75.4 Q1.2 | 75.56,76.67 90.8,76.67 90.8,71.59 95.88,71.59 97.15,72.86 IC1.16
N$20
  Top 0.254: 33.65,34.76 33.65,53.81 34.92,55.08 IC11.13 | 33.65,34.76 SV2.9 SV2.7 | 33.65,34.76 SV2.11
  Bottom 0.254: SV2.1 SV2.3 SV2.5 SV2.7 | SV2.11 SV2.13
N$21  (via drill 0.61)
  Top 0.254: v78.1,77.94 76.83,79.21 C2.2
  Bottom 0.254: C2.2 75.56,81.75 70.48,81.75 69.21,80.48 Q1.1 | v78.1,77.94 92.07,77.94 94.61,75.4 IC1.15
N$22
  Top 0.254: LED1.K R1.1
N$23
  Top 0.254: R3.2 131.44,22.06 LED2.K
N$24
  Bottom 0.254: LED4.A 128.9,66.51 102.23,66.51 100.96,65.24 IC2.6
N$25
  Top 0.254: R4.2 131.44,57.62 LED4.K
N$26
  Bottom 0.254: IC14.8 53.97,42.38 55.24,43.65 62.86,43.65 64.13,42.38 IC14.12
N$27  (via drill 0.61)
  Top 0.254: v61.59,10.63 56.51,10.63 55.24,9.36 U$5.13 | v64.13,10.63 66.67,13.17 v66.67,19.52 | v109.85,19.52 117.47,19.52 117.47,15.71 122.55,15.71 122.55,25.87 116.2,32.22 116.2,63.97 130.17,77.94 133.98,77.94 LED5.A
  Bottom 0.254: v61.59,10.63 v64.13,10.63 | v66.67,19.52 v109.85,19.52
N$28  (via drill 0.61)
  Top 0.254: v26.03,51.27 26.03,61.43 24.76,62.7 IC11.6
  Bottom 0.254: 31.11,51.27 29.84,50 IC13.4 | 43.81,51.27 57.78,51.27 59.05,50 IC14.5 | 31.11,51.27 43.81,51.27 | 31.11,51.27 v26.03,51.27 | 43.81,51.27 43.81,46.19 45.08,44.92 62.86,44.92 64.13,43.65 65.4,43.65 66.67,42.38 IC14.13
N$29
  Top 0.254: R5.2 131.44,72.86 LED5.K
N$30
  Bottom 0.254: X1.SH3 94.61,8.09 90.8,8.09 X1.SH2 88.26,8.09 84.45,8.09 X1.SH1
N$39
  Top 0.254: IC15.10 59.05,28.41 60.32,29.68 60.32,38.57 61.59,39.84 IC14.11
N$40  (via drill 0.61)
  Top 0.254: v51.43,61.43 51.43,33.49 52.7,32.22 56.51,32.22 IC15.9
  Bottom 0.254: v51.43,61.43 31.11,61.43 27.3,57.62 IC11.10
N$41  (via drill 0.61)
  Top 0.254: v33.65,23.33 33.65,28.41 32.38,28.41 28.57,32.22 28.57,37.3 29.84,37.3 31.11,38.57 31.11,53.81 29.84,55.08 IC11.11 | v59.05,23.33 61.59,25.87 IC15.11
  Bottom 0.254: v33.65,23.33 v59.05,23.33
N$42  (via drill 0.61)
  Top 0.254: SV6.5 SV6.7 SV6.9 | v50.16,24.6 57.78,24.6 57.78,43.65 60.32,46.19 60.32,61.43 59.05,62.7 IC16.5
  Bottom 0.254: IC16.5 59.05,65.24 60.32,66.51 62.86,66.51 64.13,65.24 IC16.3 | SV6.1 SV6.3 SV6.5 | SV6.9 SV6.11 SV6.13 v50.16,24.6
N$43  (via drill 0.61)
  Top 0.254: U$3.10 v90.8,60.16
  Bottom 0.254: IC16.1 69.21,62.7 88.26,62.7 v90.8,60.16 111.12,60.16 113.66,62.7 IC2.1
N$44  (via drill 0.61)
  Top 0.254: v102.23,48.73 104.77,51.27 104.77,61.43 106.04,62.7 IC2.4 | v83.18,53.81 88.26,48.73 U$3.11
  Bottom 0.254: v102.23,48.73 95.88,48.73 88.26,41.11 U$3.11 | v83.18,53.81 65.4,53.81 65.4,58.89 61.59,62.7 IC16.4
OUT  (via drill 0.61)
  Top 0.254: IC13.6 v24.76,53.81
  Bottom 0.254: v24.76,53.81 57.78,53.81 57.78,62.7 56.51,62.7 IC16.6
PORT1
  Top 0.254: IC12.14 26.03,9.36 29.84,13.17 29.84,18.25 34.92,23.33 36.19,23.33 36.19,25.87 SV6.14 38.73,28.41 38.73,34.76 SV2.14
PORT2  (via drill 0.61)
  Top 0.254: v38.73,25.87 38.73,5.55 24.76,5.55 23.49,6.82 IC12.13 | SV2.12 36.19,34.76 36.19,28.41 SV6.12
  Bottom 0.254: v38.73,25.87 36.19,25.87 SV6.12
PORT3  (via drill 0.61)
  Top 0.254: v20.95,28.41 19.68,27.14 19.68,10.63 20.95,9.36 IC12.12
  Bottom 0.254: v20.95,28.41 31.11,28.41 | 31.11,28.41 SV6.10 | SV2.10 31.11,34.76 31.11,28.41
PORT4  (via drill 0.61)
  Top 0.254: v17.14,24.6 17.14,10.63 18.41,9.36 IC12.11
  Bottom 0.254: v17.14,24.6 18.41,25.87 19.68,25.87 | 19.68,25.87 28.57,25.87 SV6.8 | SV2.8 28.57,34.76 20.95,34.76 19.68,33.49 19.68,25.87
PORT5  (via drill 0.61)
  Top 0.254: v23.49,10.63 24.76,11.9 24.76,22.06 26.03,23.33 26.03,25.87 | 26.03,25.87 SV6.6 | SV2.6 26.03,34.76 26.03,25.87
  Bottom 0.254: v23.49,10.63 17.14,10.63 15.87,9.36 IC12.10
PORT6
  Top 0.254: 23.49,25.87 23.49,23.33 22.22,22.06 22.22,5.55 14.6,5.55 13.33,6.82 IC12.9 | 23.49,25.87 SV6.4 | SV2.4 23.49,34.76 23.49,25.87
PORT7
  Top 0.254: 18.41,32.22 SV2.2 | 18.41,32.22 15.87,29.68 IC12.7 | SV6.2 22.22,28.41 18.41,32.22
RESET  (via drill 0.61)
  Top 0.254: U$1.14 23.49,84.29 22.22,85.56 22.22,90.64 9.52,90.64 9.52,25.87 6.98,23.33 6.98,19.52 5.71,18.25 U$2.27 | 60.32,14.44 61.59,13.17 64.13,13.17 64.13,18.25 62.86,19.52 62.86,43.65 v64.13,44.92 | IC1.4 94.61,80.48 95.88,79.21 U$3.8 | v57.78,11.9 60.32,14.44 | 60.32,14.44 U$5.4
  Bottom 0.254: v64.13,44.92 70.48,44.92 78.1,37.3 94.61,37.3 95.88,38.57 U$3.8 | v57.78,11.9 46.35,11.9 45.08,10.63 40,10.63 38.73,9.36 34.92,9.36 33.65,10.63 29.84,10.63 29.84,5.55 4.44,5.55 4.44,18.25 5.71,18.25 U$2.27
SC0  (via drill 0.61)
  Top 0.254: v98.42,85.56 98.42,71.59 97.15,70.32 97.15,28.41 103.5,28.41 106.04,25.87 U$3.21
  Bottom 0.254: v98.42,85.56 SV3.2
SC1
  Top 0.254: SV3.4 100.96,89.37 104.77,89.37 109.85,84.29 109.85,27.14 108.58,25.87 U$3.22
TPA  (via drill 0.61)
  Top 0.254: v79.37,50 79.37,80.48 v73.02,86.83 | v52.7,86.83 50.16,84.29 46.35,84.29 v46.35,81.75 | v48.89,81.75 45.08,77.94 v45.08,67.78 | v24.76,60.16 IC11.9
  Bottom 0.254: v79.37,50 106.04,50 U$3.4 | v52.7,86.83 v73.02,86.83 | v48.89,81.75 v46.35,81.75 | v45.08,67.78 43.81,66.51 13.33,66.51 8.25,61.43 | 8.25,61.43 6.98,60.16 5.71,60.16 U$2.11 | v24.76,60.16 23.49,61.43 8.25,61.43
TPB  (via drill 0.61)
  Top 0.254: v100.96,52.54 100.96,43.65 103.5,41.11 U$3.5 | v59.05,52.54 57.78,53.81 57.78,58.89 v56.51,58.89 | v45.08,66.51 42.54,69.05 42.54,75.4 38.73,79.21 34.92,79.21 34.92,83.02 33.65,84.29 32.38,84.29 32.38,77.94 29.84,75.4 27.3,75.4 IC11.5
  Bottom 0.254: IC11.5 27.3,58.89 8.25,58.89 6.98,57.62 5.71,57.62 U$2.12 | v59.05,52.54 v100.96,52.54 | v56.51,58.89 53.97,61.43 52.7,61.43 47.62,66.51 v45.08,66.51
VCC  (via drill 0.61)
  Top 0.254: 69.21,30.95 67.94,32.22 67.94,38.57 69.21,39.84 IC14.14 | 69.21,30.95 IC15.14 | 75.56,33.49 C7.1 | 75.56,33.49 75.56,44.92 | 75.56,44.92 C8.1 | C4.1 75.56,60.16 75.56,44.92 | v70.48,32.22 69.21,30.95 | C10.1 75.56,14.44 75.56,33.49 | C6.1 34.92,13.17 31.11,9.36 IC12.16 | C14.+ 12.06,83.02 12.06,25.87 10.79,24.6 10.79,13.17 12.06,11.9 15.87,11.9 v15.87,13.17 | LED1.A 132.71,8.09 132.71,18.25 R3.1 121.28,29.68 121.28,32.22 C5.1 118.74,34.76 C12.1 | IC2.11 IC2.12 108.58,57.62 107.31,58.89 107.31,80.48 | C3.1 v40,57.62 42.54,55.08 C13.1 40,43.65 40,37.3 38.73,37.3 37.46,38.57 IC13.14 | 52.7,66.51 50.16,69.05 50.16,70.32 48.89,71.59 U$1.24 | 52.7,66.51 53.97,66.51 C11.1 | 107.31,80.48 C9.1 | 107.31,80.48 106.04,81.75 106.04,86.83 95.88,86.83 93.34,84.29 93.34,76.67 92.07,75.4 IC1.14 | v48.89,60.16 52.7,63.97 52.7,66.51
  Bottom 0.254: 57.78,6.82 59.05,5.55 64.13,5.55 65.4,6.82 | 75.56,11.9 C10.1 | 75.56,11.9 85.72,11.9 X1.5 | 75.56,11.9 67.94,11.9 65.4,9.36 U$5.17 65.4,6.82 | IC16.14 71.75,56.35 73.02,57.62 73.02,61.43 C4.1 | C7.1 v70.48,32.22 | C14.+ 14.6,85.56 5.71,85.56 U$2.1 | 19.68,13.17 18.41,14.44 IC12.6 | 19.68,13.17 C6.1 | v15.87,13.17 19.68,13.17 | 57.78,6.82 56.51,5.55 32.38,5.55 31.11,6.82 IC12.16 | 57.78,6.82 U$5.14 | C5.1 113.66,33.49 U$3.24 | IC2.11 IC2.10 | IC2.12 IC2.13 IC2.14 113.66,57.62 C12.1 | v40,57.62 37.46,57.62 IC11.14 | C9.1 C11.1 | v48.89,60.16 C3.1 | 65.4,6.82 66.67,5.55 111.12,5.55 112.39,4.28 131.44,4.28 LED1.A

### Text on the board
tNames: Video/Keyboard | PAK/DA | Video | PIC | EFK - BUS | KEYPRESS | KEYBOARD PORT | VIDEO PORT | PWR